# Altium project AnalogCircuits.PrjPcb
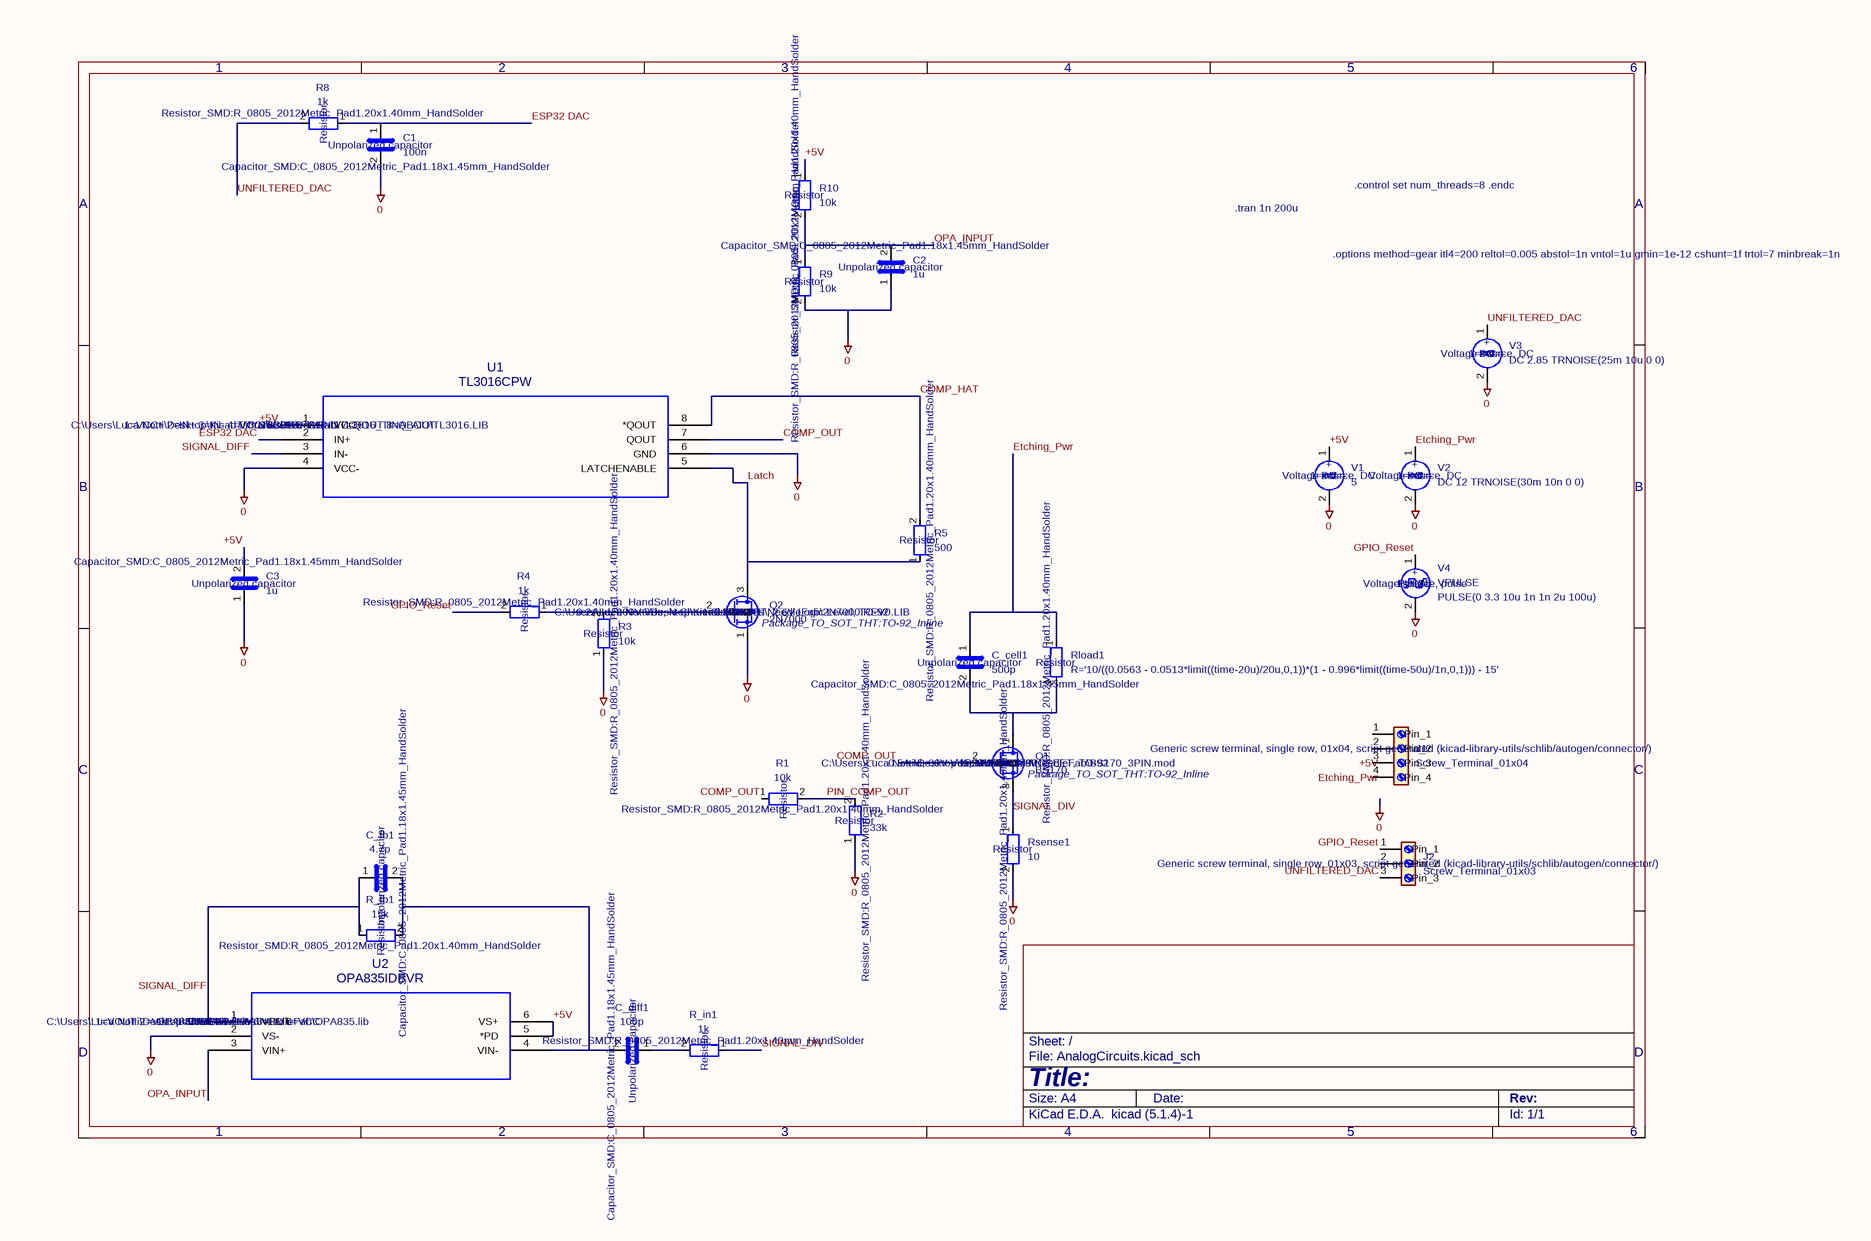
[diagram p0: AnalogCircuits.SchDoc]
2 sheets, 61 parts. Net scope: global (net labels, ports and power ports of the same name join across sheets).
Board files: SensorAnalog.PcbDoc, SensorAnalog(1).PcbDoc
Sheets:
  AnalogCircuits.SchDoc
  SensorAnalog.SchDoc

## Sheet AnalogCircuits.SchDoc
size 297 x 209 mm

### Parts
(Parts that share a designator on the sheet are numbered #1, #2 ... from top to bottom, then left to right.)
C1#1  Description: Unpolarized capacitor  Footprint: Capacitor_SMD:C_0805_2012Metric_Pad1.18x1.45mm_HandSolder  [C_0805_2012Metric_Pad1.18x1.45mm_HandSolder]  (hidden comment: 100n)
C2#1  Description: Unpolarized capacitor  Footprint: Capacitor_SMD:C_0805_2012Metric_Pad1.18x1.45mm_HandSolder  [C_0805_2012Metric_Pad1.18x1.45mm_HandSolder]  (hidden comment: 1u)
C3#1  Description: Unpolarized capacitor  Footprint: Capacitor_SMD:C_0805_2012Metric_Pad1.18x1.45mm_HandSolder  [C_0805_2012Metric_Pad1.18x1.45mm_HandSolder]  (hidden comment: 1u)
C_cell1#1  Description: Unpolarized capacitor  Footprint: Capacitor_SMD:C_0805_2012Metric_Pad1.18x1.45mm_HandSolder  [C_0805_2012Metric_Pad1.18x1.45mm_HandSolder]  (hidden comment: 500p)
C_diff1#1  Description: Unpolarized capacitor  Footprint: Capacitor_SMD:C_0805_2012Metric_Pad1.18x1.45mm_HandSolder  [C_0805_2012Metric_Pad1.18x1.45mm_HandSolder]  (hidden comment: 100p)
C_fb1#1  Description: Unpolarized capacitor  Footprint: Capacitor_SMD:C_0805_2012Metric_Pad1.18x1.45mm_HandSolder  [C_0805_2012Metric_Pad1.18x1.45mm_HandSolder]  (hidden comment: 4.7p)
J1  Description: Generic screw terminal, single row, 01x04, script generated (kicad-library-utils/schlib/autogen/connector/)  (hidden comment: Screw_Terminal_01x04)
J2  Description: Generic screw terminal, single row, 01x03, script generated (kicad-library-utils/schlib/autogen/connector/)  (hidden comment: Screw_Terminal_01x03)
Q1#1  Description: 0.5A Id, 60V Vds, N-Channel MOSFET, TO-92  Sim.Library: C:\Users\Luca Notti\Desktop\Kicad Libraries\NeedleFab\BS170_3PIN.mod  Sim.Name: BS/MMBF170  Sim.Device: SUBCKT  Sim.Pins: 1=20 2=10 3=30  Footprint: Package_TO_SOT_THT:TO-92_Inline  [TO-92_Inline]  (hidden comment: BS170)
Q2#1  Description: 0.2A Id, 200V Vds, N-Channel MOSFET, 2.6V Logic Level, TO-92  Sim.Library: C:\Users\Luca Notti\Desktop\Kicad Libraries\NeedleFab\2N7000.REV0.LIB  Sim.Device: SUBCKT  Sim.Pins: 1=3 2=2 3=1  Footprint: Package_TO_SOT_THT:TO-92_Inline  [TO-92_Inline]  (hidden comment: 2N7000)
R1#1  Description: Resistor  Footprint: Resistor_SMD:R_0805_2012Metric_Pad1.20x1.40mm_HandSolder  [R_0805_2012Metric_Pad1.20x1.40mm_HandSolder]  (hidden comment: 10k)
R2#1  Description: Resistor  Footprint: Resistor_SMD:R_0805_2012Metric_Pad1.20x1.40mm_HandSolder  [R_0805_2012Metric_Pad1.20x1.40mm_HandSolder]  (hidden comment: 33k)
R3#1  Description: Resistor  Footprint: Resistor_SMD:R_0805_2012Metric_Pad1.20x1.40mm_HandSolder  [R_0805_2012Metric_Pad1.20x1.40mm_HandSolder]  (hidden comment: 10k)
R4#1  Description: Resistor  Footprint: Resistor_SMD:R_0805_2012Metric_Pad1.20x1.40mm_HandSolder  [R_0805_2012Metric_Pad1.20x1.40mm_HandSolder]  (hidden comment: 1k)
R5#1  Description: Resistor  Footprint: Resistor_SMD:R_0805_2012Metric_Pad1.20x1.40mm_HandSolder  [R_0805_2012Metric_Pad1.20x1.40mm_HandSolder]  (hidden comment: 500)
R8#1  Description: Resistor  Footprint: Resistor_SMD:R_0805_2012Metric_Pad1.20x1.40mm_HandSolder  [R_0805_2012Metric_Pad1.20x1.40mm_HandSolder]  (hidden comment: 1k)
R9#1  Description: Resistor  Footprint: Resistor_SMD:R_0805_2012Metric_Pad1.20x1.40mm_HandSolder  [R_0805_2012Metric_Pad1.20x1.40mm_HandSolder]  (hidden comment: 10k)
R10#1  Description: Resistor  Footprint: Resistor_SMD:R_0805_2012Metric_Pad1.20x1.40mm_HandSolder  [R_0805_2012Metric_Pad1.20x1.40mm_HandSolder]  (hidden comment: 10k)
R_fb1#1  Description: Resistor  Footprint: Resistor_SMD:R_0805_2012Metric_Pad1.20x1.40mm_HandSolder  [R_0805_2012Metric_Pad1.20x1.40mm_HandSolder]  (hidden comment: 15k)
R_in1#1  Description: Resistor  Footprint: Resistor_SMD:R_0805_2012Metric_Pad1.20x1.40mm_HandSolder  [R_0805_2012Metric_Pad1.20x1.40mm_HandSolder]  (hidden comment: 1k)
Rload1#1  Description: Resistor  Footprint: Resistor_SMD:R_0805_2012Metric_Pad1.20x1.40mm_HandSolder  [R_0805_2012Metric_Pad1.20x1.40mm_HandSolder]  (hidden comment: R='10/((0.0563 - 0.0513*limit((time-20u)/20u,0,1))*(1 - 0.996*limit((time-50u)/1n,0,1))) - 15')
Rsense1#1  Description: Resistor  Footprint: Resistor_SMD:R_0805_2012Metric_Pad1.20x1.40mm_HandSolder  [R_0805_2012Metric_Pad1.20x1.40mm_HandSolder]  (hidden comment: 10)
U1#1  Sim.Library: C:\Users\Luca Notti\Desktop\Kicad Libraries\NeedleFab\TL3016_TINA_AIO\TL3016.LIB  Sim.Name: TL3016  Sim.Device: SUBCKT  Sim.Pins: 1=VCC+ 2=IN+ 3=IN- 4=VCC- 5=LE 6=GRND 7=QOUT 8=QBOUT  Footprint: TL3016CPW:PW8  [PW8]  (hidden comment: TL3016CPW)
U2  Sim.Library: C:\Users\Luca Notti\Desktop\Kicad Libraries\NeedleFab\OPA835.lib  Sim.Name: OPA835  Sim.Device: SUBCKT  Sim.Pins: 1=VOUT 2=VEE 3=VINP 4=VINM 5=PD 6=VCC  Footprint: OPA835IDBVR:DBV6  [DBV6]  (hidden comment: OPA835IDBVR)
V1#1  Description: Voltage source, DC  Sim.Pins: 1=+ 2=-  Sim.Type: DC  Sim.Device: V  (hidden comment: 5)
V2#1  Description: Voltage source, DC  Sim.Pins: 1=+ 2=-  Sim.Type: DC  Sim.Device: V  (hidden comment: DC 12 TRNOISE(30m 10n 0 0))
V3#1  Description: Voltage source, DC  Sim.Pins: 1=+ 2=-  Sim.Type: DC  Sim.Device: V  (hidden comment: DC 2.85 TRNOISE(25m 10u 0 0))
V4#1  Description: Voltage source, pulse  Sim.Pins: 1=+ 2=-  Sim.Type: PULSE  Sim.Device: V  Sim.Params: PULSE(0 3.3 10u 1n 1n 2u 100u)  (hidden comment: VPULSE)

### Nets
0: C1#1.2 C2#1.1 C3#1.1 Q2#1.1(S) R2#1.1 R3#1.1 R9#1.2 Rsense1#1.2 U1#1.4(VCC-) U1#1.6(GND) U2.2(VS-) V1#1.2 V2#1.2 V3#1.2 V4#1.2
+5V: C3#1.2 R10#1.1 U1#1.1(VCC+) U2.5(*PD) U2.6(VS+) V1#1.1
COMP_HAT: R5#1.2 U1#1.8(*QOUT)
COMP_OUT: Q1#1.2(G) R1#1.1 U1#1.7(QOUT)
ESP32 DAC: C1#1.1 R8#1.1 U1#1.2(IN+)
Etching_Pwr: C_cell1#1.1 Rload1#1.1 V2#1.1
GPIO_Reset: J2.1(Pin_1) R4#1.2 V4#1.1
Latch: Q2#1.3(D) R5#1.1 U1#1.5(LATCHENABLE)
OPA_INPUT: C2#1.2 R9#1.1 R10#1.2 U2.3(VIN+)
PIN_COMP_OUT: R1#1.2 R2#1.2
SIGNAL_DIFF: C_fb1#1.1 R_fb1#1.1 U1#1.3(IN-) U2.1(VOUT)
SIGNAL_DIV: Q1#1.3(S) R_in1#1.1 Rsense1#1.1
UNFILTERED_DAC: J2.3(Pin_3) R8#1.2 V3#1.1
NetC_cell1#1_2: C_cell1#1.2 Q1#1.1(D) Rload1#1.2
NetC_diff1#1_1: C_diff1#1.1 R_in1#1.2
NetC_diff1#1_2: C_diff1#1.2 C_fb1#1.2 R_fb1#1.2 U2.4(VIN-)
NetQ2#1_2: Q2#1.2(G) R3#1.2 R4#1.1

Not connected (* = marked no-connect by the designer): J1 1(Pin_1) 2(Pin_2) 3(Pin_3) 4(Pin_4); J2 2(Pin_2)

### Notes on the sheet
- .tran 1n 200u
- .control
  set num_threads=8
  .endc
- .options method=gear itl4=200 reltol=0.005 abstol=1n vntol=1u gmin=1e-12 cshunt=1f trtol=7 minbreak=1n
- Labels drawn without touching a wire or pin: +5V, Etching_Pwr
- 1
- 2
- 3
- 4
- 5
- 6
- A
- B
- C
- D
- Title:
- File: AnalogCircuits.kicad_sch
- Sheet: /
- KiCad E.D.A.  kicad (5.1.4)-1
- Size: A4
- Date:
- Rev:
- Id: 1/1
- (in symbol VDC) +
- (in symbol VPULSE) +

### Library data of the parts
C1#1 C2#1 C3#1 C_cell1#1 C_diff1#1 C_fb1#1 = C
  C1#1: Value: 100n
  C2#1 C3#1: Value: 1u
  C_cell1#1: Value: 500p
  C_diff1#1: Value: 100p
  C_fb1#1: Value: 4.7p
R1#1 R2#1 R3#1 R4#1 R5#1 R8#1 R9#1 R10#1 R_fb1#1 R_in1#1 Rload1#1 Rsense1#1 = R
  R1#1 R3#1 R9#1 R10#1: Value: 10k
  R2#1: Value: 33k
  R4#1 R8#1 R_in1#1: Value: 1k
  R5#1: Value: 500
  R_fb1#1: Value: 15k
  Rload1#1: Value: R='10/((0.0563 - 0.0513*limit((time-20u)/20u,0,1))*(1 - 0.996*limit((time-50u)/1n,0,1))) - 15'
  Rsense1#1: Value: 10
V1#1 V2#1 V3#1 = VDC
  V1#1: Value: 5
  V2#1: Value: DC 12 TRNOISE(30m 10n 0 0)
  V3#1: Value: DC 2.85 TRNOISE(25m 10u 0 0)
J1 = Screw_Terminal_01x04: Value: Screw_Terminal_01x04
J2 = Screw_Terminal_01x03: Value: Screw_Terminal_01x03
Q1#1 = BS170: Value: BS170
Q2#1 = 2N7000: Sim.Name: 2n7000; Value: 2N7000
U1#1 = TL3016CPW: Value: TL3016CPW
U2 = OPA835IDBVR: Value: OPA835IDBVR
V4#1 = VPULSE: Value: VPULSE

## Sheet SensorAnalog.SchDoc
size 320 x 320 mm
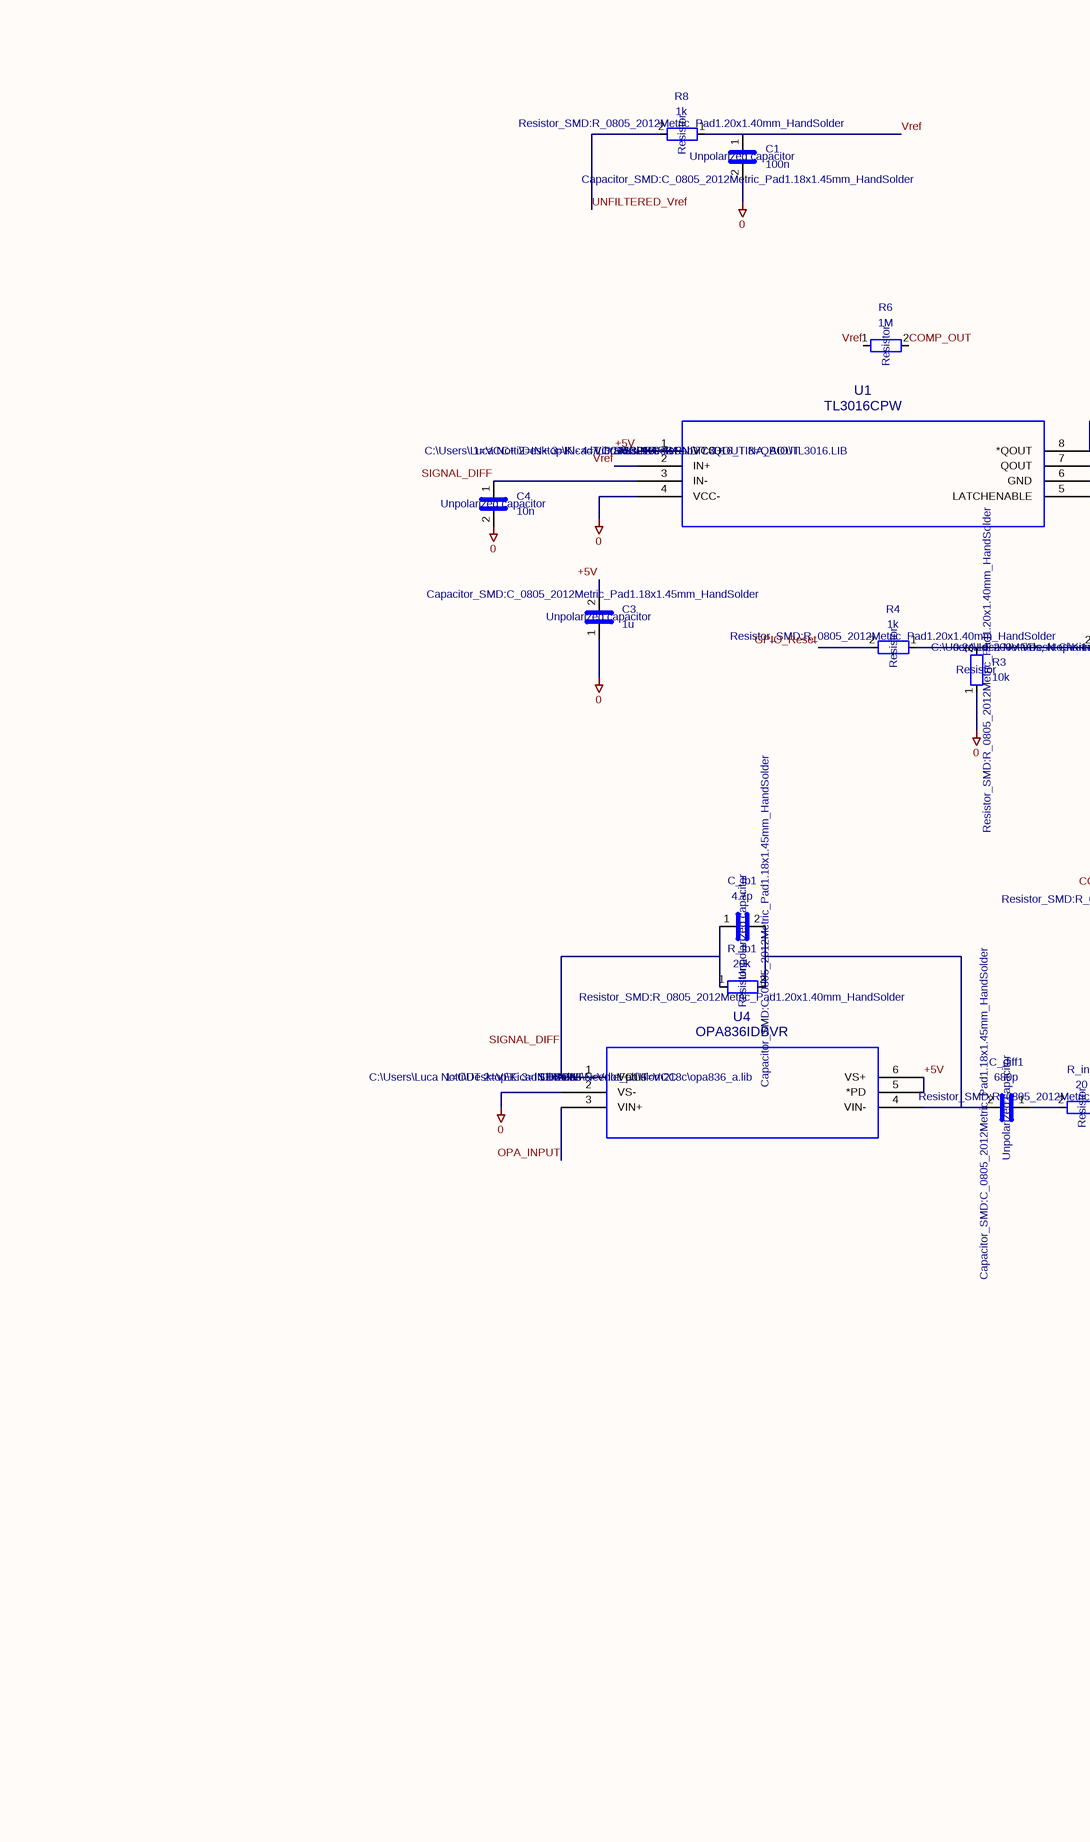
[diagram p1: SensorAnalog.SchDoc, left]
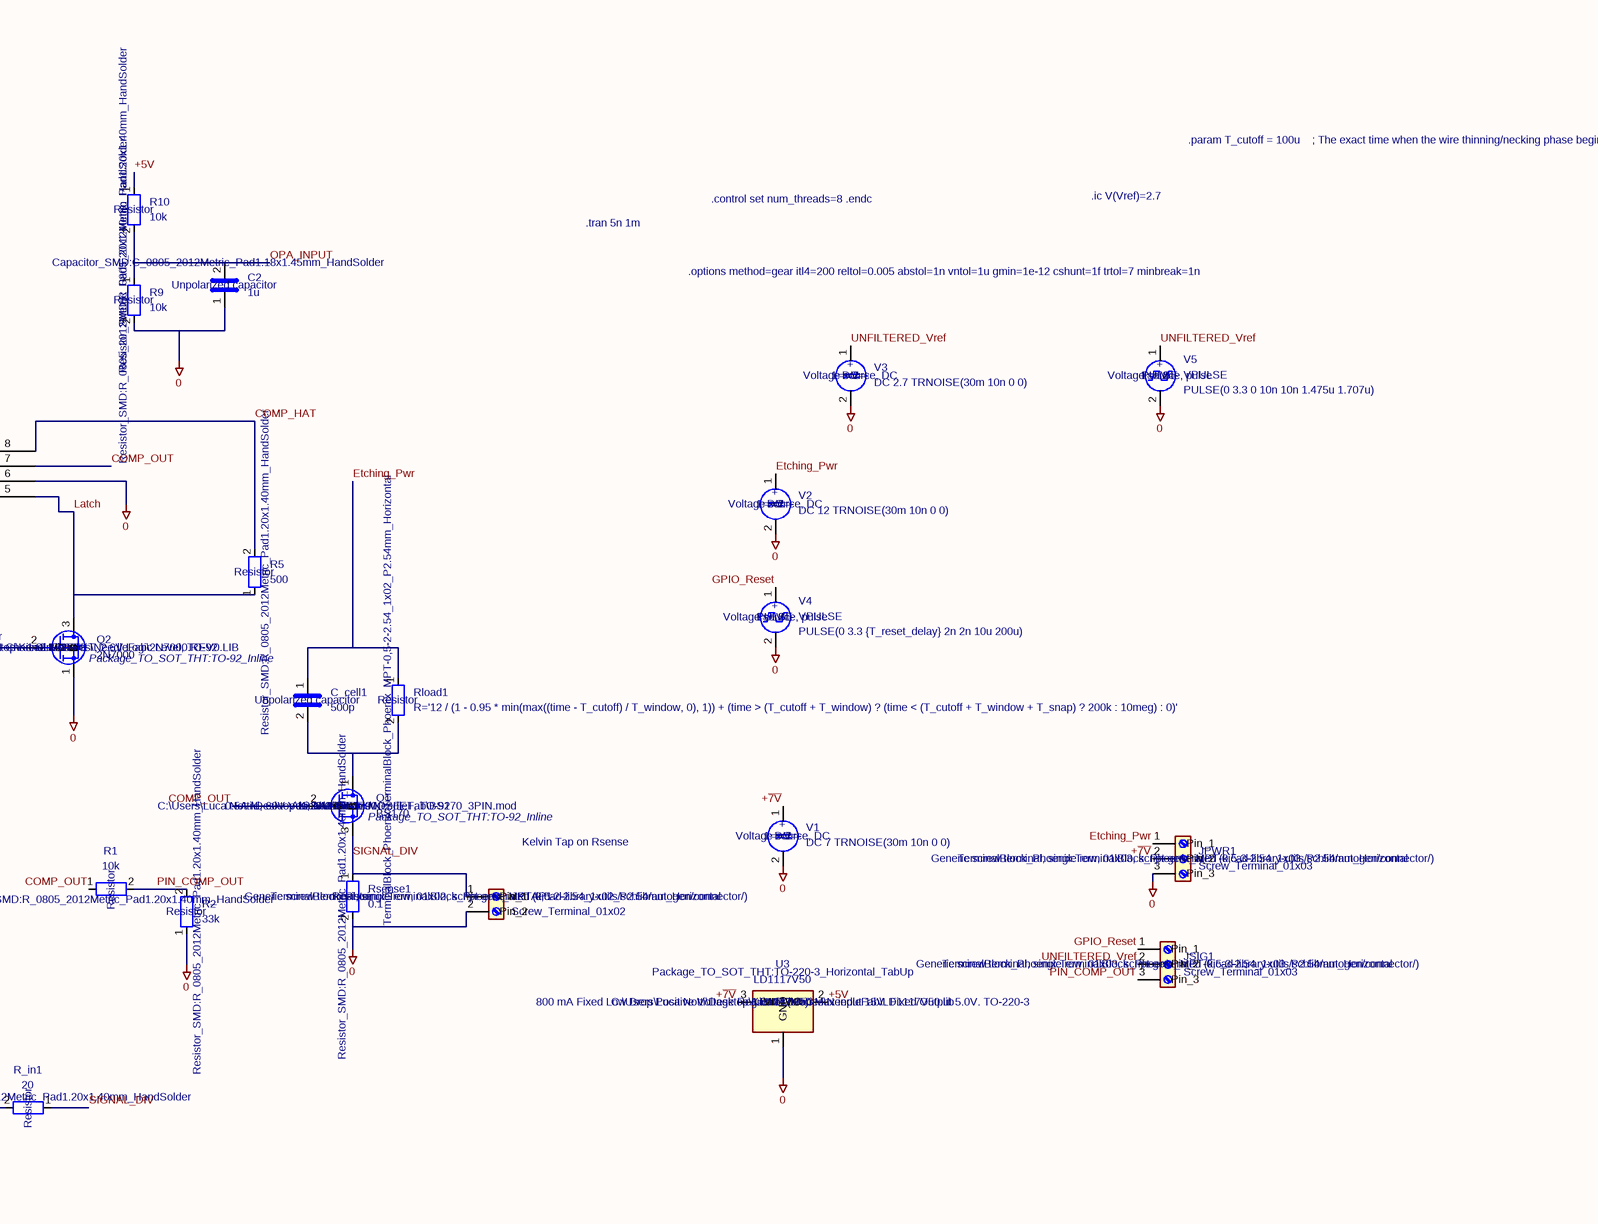
[diagram p2: SensorAnalog.SchDoc, right]

### Parts
(Parts that share a designator on the sheet are numbered #1, #2 ... from top to bottom, then left to right.)
C1#2  Description: Unpolarized capacitor  Footprint: Capacitor_SMD:C_0805_2012Metric_Pad1.18x1.45mm_HandSolder  [C_0805_2012Metric_Pad1.18x1.45mm_HandSolder]  (hidden comment: 100n)
C2#2  Description: Unpolarized capacitor  Footprint: Capacitor_SMD:C_0805_2012Metric_Pad1.18x1.45mm_HandSolder  [C_0805_2012Metric_Pad1.18x1.45mm_HandSolder]  (hidden comment: 1u)
C3#2  Description: Unpolarized capacitor  Footprint: Capacitor_SMD:C_0805_2012Metric_Pad1.18x1.45mm_HandSolder  [C_0805_2012Metric_Pad1.18x1.45mm_HandSolder]  (hidden comment: 1u)
C4  Description: Unpolarized capacitor  (hidden comment: 10n)
C_cell1#2  Description: Unpolarized capacitor  (hidden comment: 500p)
C_diff1#2  Description: Unpolarized capacitor  Footprint: Capacitor_SMD:C_0805_2012Metric_Pad1.18x1.45mm_HandSolder  [C_0805_2012Metric_Pad1.18x1.45mm_HandSolder]  (hidden comment: 680p)
C_fb1#2  Description: Unpolarized capacitor  Footprint: Capacitor_SMD:C_0805_2012Metric_Pad1.18x1.45mm_HandSolder  [C_0805_2012Metric_Pad1.18x1.45mm_HandSolder]  (hidden comment: 4.7p)
JKTAP1  Description: Generic screw terminal, single row, 01x02, script generated (kicad-library-utils/schlib/autogen/connector/)  Footprint: TerminalBlock_Phoenix:TerminalBlock_Phoenix_MPT-0,5-2-2.54_1x02_P2.54mm_Horizontal  [TerminalBlock_Phoenix_MPT-0,5-2-2.54_1x02_P2.54mm_Horizontal]  (hidden comment: Screw_Terminal_01x02)
JPWR1  Description: Generic screw terminal, single row, 01x03, script generated (kicad-library-utils/schlib/autogen/connector/)  Footprint: TerminalBlock_Phoenix:TerminalBlock_Phoenix_MPT-0,5-3-2.54_1x03_P2.54mm_Horizontal  [TerminalBlock_Phoenix_MPT-0,5-3-2.54_1x03_P2.54mm_Horizontal]  (hidden comment: Screw_Terminal_01x03)
JSIG1  Description: Generic screw terminal, single row, 01x03, script generated (kicad-library-utils/schlib/autogen/connector/)  Footprint: TerminalBlock_Phoenix:TerminalBlock_Phoenix_MPT-0,5-3-2.54_1x03_P2.54mm_Horizontal  [TerminalBlock_Phoenix_MPT-0,5-3-2.54_1x03_P2.54mm_Horizontal]  (hidden comment: Screw_Terminal_01x03)
Q1#2  Description: 0.5A Id, 60V Vds, N-Channel MOSFET, TO-92  Sim.Library: C:\Users\Luca Notti\Desktop\Kicad Libraries\NeedleFab\BS170_3PIN.mod  Sim.Name: BS/MMBF170  Sim.Device: SUBCKT  Sim.Pins: 1=20 2=10 3=30  Footprint: Package_TO_SOT_THT:TO-92_Inline  [TO-92_Inline]  (hidden comment: BS170)
Q2#2  Description: 0.2A Id, 200V Vds, N-Channel MOSFET, 2.6V Logic Level, TO-92  Sim.Library: C:\Users\Luca Notti\Desktop\Kicad Libraries\NeedleFab\2N7000.REV0.LIB  Sim.Device: SUBCKT  Sim.Pins: 1=3 2=2 3=1  Footprint: Package_TO_SOT_THT:TO-92_Inline  [TO-92_Inline]  (hidden comment: 2N7000)
R1#2  Description: Resistor  Footprint: Resistor_SMD:R_0805_2012Metric_Pad1.20x1.40mm_HandSolder  [R_0805_2012Metric_Pad1.20x1.40mm_HandSolder]  (hidden comment: 10k)
R2#2  Description: Resistor  Footprint: Resistor_SMD:R_0805_2012Metric_Pad1.20x1.40mm_HandSolder  [R_0805_2012Metric_Pad1.20x1.40mm_HandSolder]  (hidden comment: 33k)
R3#2  Description: Resistor  Footprint: Resistor_SMD:R_0805_2012Metric_Pad1.20x1.40mm_HandSolder  [R_0805_2012Metric_Pad1.20x1.40mm_HandSolder]  (hidden comment: 10k)
R4#2  Description: Resistor  Footprint: Resistor_SMD:R_0805_2012Metric_Pad1.20x1.40mm_HandSolder  [R_0805_2012Metric_Pad1.20x1.40mm_HandSolder]  (hidden comment: 1k)
R5#2  Description: Resistor  Footprint: Resistor_SMD:R_0805_2012Metric_Pad1.20x1.40mm_HandSolder  [R_0805_2012Metric_Pad1.20x1.40mm_HandSolder]  (hidden comment: 500)
R6  Description: Resistor  (hidden comment: 1M)
R8#2  Description: Resistor  Footprint: Resistor_SMD:R_0805_2012Metric_Pad1.20x1.40mm_HandSolder  [R_0805_2012Metric_Pad1.20x1.40mm_HandSolder]  (hidden comment: 1k)
R9#2  Description: Resistor  Footprint: Resistor_SMD:R_0805_2012Metric_Pad1.20x1.40mm_HandSolder  [R_0805_2012Metric_Pad1.20x1.40mm_HandSolder]  (hidden comment: 10k)
R10#2  Description: Resistor  Footprint: Resistor_SMD:R_0805_2012Metric_Pad1.20x1.40mm_HandSolder  [R_0805_2012Metric_Pad1.20x1.40mm_HandSolder]  (hidden comment: 10k)
R_fb1#2  Description: Resistor  Footprint: Resistor_SMD:R_0805_2012Metric_Pad1.20x1.40mm_HandSolder  [R_0805_2012Metric_Pad1.20x1.40mm_HandSolder]  (hidden comment: 20k)
R_in1#2  Description: Resistor  Footprint: Resistor_SMD:R_0805_2012Metric_Pad1.20x1.40mm_HandSolder  [R_0805_2012Metric_Pad1.20x1.40mm_HandSolder]  (hidden comment: 20)
Rload1#2  Description: Resistor  Footprint: TerminalBlock_Phoenix:TerminalBlock_Phoenix_MPT-0,5-2-2.54_1x02_P2.54mm_Horizontal  [TerminalBlock_Phoenix_MPT-0,5-2-2.54_1x02_P2.54mm_Horizontal]  (hidden comment: R='12 / (1 - 0.95 * min(max((time - T_cutoff) / T_window, 0), 1)) + (time > (T_cutoff + T_window) ? (time < (T_cutoff + T_window + T_snap) ? 200k : 10meg) : 0)')
Rsense1#2  Description: Resistor  Footprint: Resistor_SMD:R_0805_2012Metric_Pad1.20x1.40mm_HandSolder  [R_0805_2012Metric_Pad1.20x1.40mm_HandSolder]  (hidden comment: 0.1)
U1#2  Sim.Library: C:\Users\Luca Notti\Desktop\Kicad Libraries\NeedleFab\TL3016_TINA_AIO\TL3016.LIB  Sim.Name: TL3016  Sim.Device: SUBCKT  Sim.Pins: 1=VCC+ 2=IN+ 3=IN- 4=VCC- 5=LE 6=GRND 7=QOUT 8=QBOUT  Footprint: TL3016CPW:PW8  [PW8]  (hidden comment: TL3016CPW)
U3  Description: 800 mA Fixed Low Drop Positive Voltage Regulator (ldo). Max input 15V. Fixed Output 5.0V. TO-220-3  Sim.Library: C:\Users\Luca Notti\Desktop\Kicad Libraries\NeedleFab\LD1117V50.lib  Sim.Device: SUBCKT  Sim.Pins: 1=1 2=2 3=3  Footprint: Package_TO_SOT_THT:TO-220-3_Horizontal_TabUp  [TO-220-3_Horizontal_TabUp]  (hidden comment: LD1117V50)
U4  Sim.Library: C:\Users\Luca Notti\Desktop\Kicad Libraries\NeedleFab\slom218c\opa836_a.lib  Sim.Name: OPA836  Sim.Device: SUBCKT  Sim.Pins: 1=OUT 2=VEE 3=IN+ 4=IN- 5=Vnot_pd 6=VCC  [DBV6]  (hidden comment: OPA836IDBVR)
V1#2  Description: Voltage source, DC  Sim.Pins: 1=+ 2=-  Sim.Type: DC  Sim.Device: V  (hidden comment: DC 7 TRNOISE(30m 10n 0 0))
V2#2  Description: Voltage source, DC  Sim.Pins: 1=+ 2=-  Sim.Type: DC  Sim.Device: V  (hidden comment: DC 12 TRNOISE(30m 10n 0 0))
V3#2  Description: Voltage source, DC  Sim.Pins: 1=+ 2=-  Sim.Type: DC  Sim.Device: V  (hidden comment: DC 2.7 TRNOISE(30m 10n 0 0))
V4#2  Description: Voltage source, pulse  Sim.Pins: 1=+ 2=-  Sim.Type: PULSE  Sim.Device: V  Sim.Params: PULSE(0 3.3 {T_reset_delay} 2n 2n 10u 200u)  (hidden comment: VPULSE)
V5  Description: Voltage source, pulse  Sim.Pins: 1=+ 2=-  Sim.Type: PULSE  Sim.Device: V  Sim.Params: PULSE(0 3.3 0 10n 10n 1.475u 1.707u)  (hidden comment: VPULSE)

### Nets
0: C1#2.2 C2#2.1 C3#2.1 C4.2 JKTAP1.2(Pin_2) JPWR1.3(Pin_3) Q2#2.1(S) R2#2.1 R3#2.1 R9#2.2 Rsense1#2.2 U1#2.4(VCC-) U1#2.6(GND) U3.1(GND) U4.2(VS-) V1#2.2 V2#2.2 V3#2.2 V4#2.2 V5.2
+5V: C3#2.2 R10#2.1 U1#2.1(VCC+) U3.2(VO) U4.5(*PD) U4.6(VS+)
+~{7V}: JPWR1.2(Pin_2) U3.3(VI) V1#2.1
COMP_HAT: R5#2.2 U1#2.8(*QOUT)
COMP_OUT: Q1#2.2(G) R1#2.1 R6.2 U1#2.7(QOUT)
Etching_Pwr: C_cell1#2.1 JPWR1.1(Pin_1) Rload1#2.1 V2#2.1
GPIO_Reset: JSIG1.1(Pin_1) R4#2.2 V4#2.1
Latch: Q2#2.3(D) R5#2.1 U1#2.5(LATCHENABLE)
OPA_INPUT: C2#2.2 R9#2.1 R10#2.2 U4.3(VIN+)
PIN_COMP_OUT: JSIG1.3(Pin_3) R1#2.2 R2#2.2
SIGNAL_DIFF: C4.1 C_fb1#2.1 R_fb1#2.1 U1#2.3(IN-) U4.1(VOUT)
SIGNAL_DIV: JKTAP1.1(Pin_1) Q1#2.3(S) R_in1#2.1 Rsense1#2.1
UNFILTERED_Vref: JSIG1.2(Pin_2) R8#2.2 V3#2.1 V5.1
Vref: C1#2.1 R6.1 R8#2.1 U1#2.2(IN+)
NetC_cell1#2_2: C_cell1#2.2 Q1#2.1(D) Rload1#2.2
NetC_diff1#2_1: C_diff1#2.1 R_in1#2.2
NetC_diff1#2_2: C_diff1#2.2 C_fb1#2.2 R_fb1#2.2 U4.4(VIN-)
NetQ2#2_2: Q2#2.2(G) R3#2.2 R4#2.1

### Notes on the sheet
- .param T_cutoff = 100u    ; The exact time when the wire thinning/necking phase begins
  .param T_window = 30u     ; The duration of the thinning phase before the snap (30us)
  .param T_snap = 5n       ; The microsecond-level physical break duration (10ns)
  .param T_reset_delay = 50u ; Delay time for your 2N7000 reset pulse
- .tran 5n 1m
- .control
  set num_threads=8
  .endc
- .ic V(Vref)=2.7
- .options method=gear itl4=200 reltol=0.005 abstol=1n vntol=1u gmin=1e-12 cshunt=1f trtol=7 minbreak=1n
- (near JKTAP1) Kelvin Tap on Rsense
- 1
- 2
- 3
- 4
- 5
- 6
- A
- B
- C
- D
- E
- F
- Title:
- File: SensorAnalog.kicad_sch
- Sheet: /
- KiCad E.D.A.  kicad (5.1.4)-1
- Size: GERBER
- Date:
- Rev:
- Id: 1/1
- (in symbol VDC) +
- (in symbol VPULSE) +

### Library data of the parts
C1#2 C2#2 C3#2 C4 C_cell1#2 C_diff1#2 C_fb1#2 = C
  C1#2: Value: 100n
  C2#2 C3#2: Value: 1u
  C4: Value: 10n
  C_cell1#2: Value: 500p
  C_diff1#2: Value: 680p
  C_fb1#2: Value: 4.7p
R1#2 R2#2 R3#2 R4#2 R5#2 R6 R8#2 R9#2 R10#2 R_fb1#2 R_in1#2 Rload1#2 Rsense1#2 = R
  R1#2 R3#2 R9#2 R10#2: Value: 10k
  R2#2: Value: 33k
  R4#2 R8#2: Value: 1k
  R5#2: Value: 500
  R6: Value: 1M
  R_fb1#2: Value: 20k
  R_in1#2: Value: 20
  Rload1#2: Value: R='12 / (1 - 0.95 * min(max((time - T_cutoff) / T_window, 0), 1)) + (time > (T_cutoff + T_window) ? (time < (T_cutoff + T_window + T_snap) ? 200k : 10meg) : 0)'
  Rsense1#2: Value: 0.1
V1#2 V2#2 V3#2 = VDC
  V1#2: Value: DC 7 TRNOISE(30m 10n 0 0)
  V2#2: Value: DC 12 TRNOISE(30m 10n 0 0)
  V3#2: Value: DC 2.7 TRNOISE(30m 10n 0 0)
JKTAP1 = Screw_Terminal_01x02: Value: Screw_Terminal_01x02
JPWR1 JSIG1 = Screw_Terminal_01x03: Value: Screw_Terminal_01x03
Q1#2 = BS170: Value: BS170
Q2#2 = 2N7000: Sim.Name: 2n7000; Value: 2N7000
U1#2 = TL3016CPW: Value: TL3016CPW
U3 = LD1117V50: Sim.Name: LD1117V50; Value: LD1117V50
U4 = OPA836IDBVR: Value: OPA836IDBVR
V4#2 V5 = VPULSE: Value: VPULSE

## Nets that join several sheets
0: AnalogCircuits (15 pins), SensorAnalog (20 pins)
+5V: AnalogCircuits (6 pins), SensorAnalog (6 pins)
COMP_HAT: AnalogCircuits (R5#1.2 U1#1.8), SensorAnalog (R5#2.2 U1#2.8)
COMP_OUT: AnalogCircuits (Q1#1.2 R1#1.1 U1#1.7), SensorAnalog (Q1#2.2 R1#2.1 R6.2 U1#2.7)
Etching_Pwr: AnalogCircuits (C_cell1#1.1 Rload1#1.1 V2#1.1), SensorAnalog (C_cell1#2.1 JPWR1.1 Rload1#2.1 V2#2.1)
GPIO_Reset: AnalogCircuits (J2.1 R4#1.2 V4#1.1), SensorAnalog (JSIG1.1 R4#2.2 V4#2.1)
Latch: AnalogCircuits (Q2#1.3 R5#1.1 U1#1.5), SensorAnalog (Q2#2.3 R5#2.1 U1#2.5)
OPA_INPUT: AnalogCircuits (C2#1.2 R9#1.1 R10#1.2 U2.3), SensorAnalog (C2#2.2 R9#2.1 R10#2.2 U4.3)
PIN_COMP_OUT: AnalogCircuits (R1#1.2 R2#1.2), SensorAnalog (JSIG1.3 R1#2.2 R2#2.2)
SIGNAL_DIFF: AnalogCircuits (C_fb1#1.1 R_fb1#1.1 U1#1.3 U2.1), SensorAnalog (5 pins)
SIGNAL_DIV: AnalogCircuits (Q1#1.3 R_in1#1.1 Rsense1#1.1), SensorAnalog (JKTAP1.1 Q1#2.3 R_in1#2.1 Rsense1#2.1)